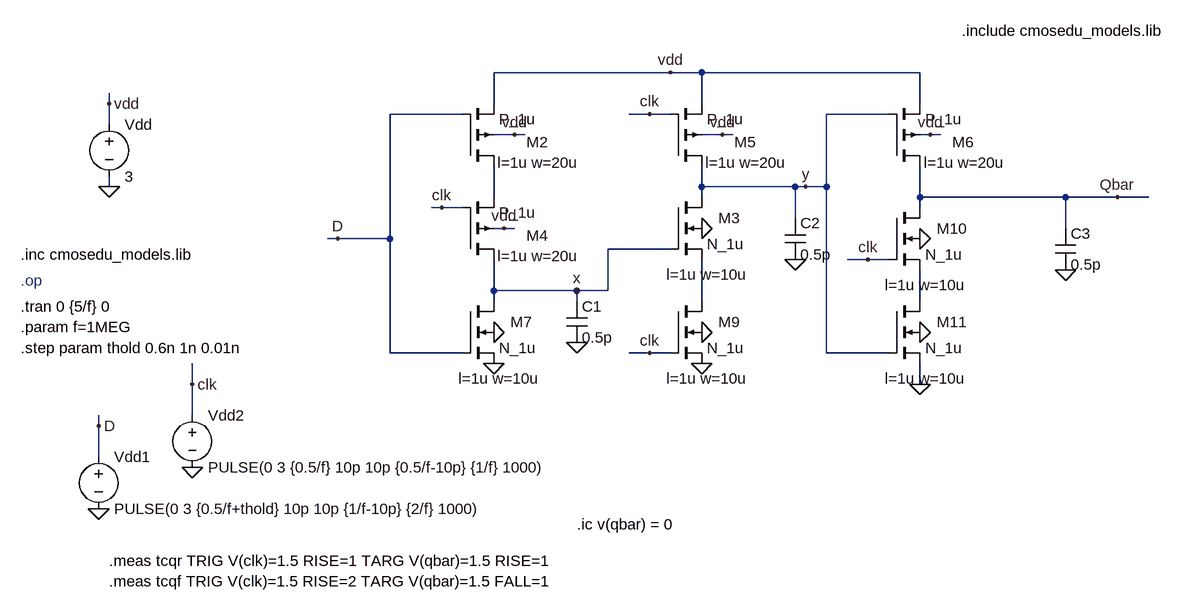
[diagram p0: schematic D_flipflop_hold_time.asc]
D_flipflop_hold_time.asc, the LTspice schematic file:
Version 4.1
SHEET 1 3268 1552
WIRE 1408 352 1136 352
WIRE 1456 352 1408 352
WIRE 1792 352 1456 352
WIRE 544 400 544 384
WIRE 1136 400 1136 352
WIRE 1456 400 1456 352
WIRE 1792 400 1792 352
WIRE 1088 416 976 416
WIRE 1376 416 1344 416
WIRE 1408 416 1376 416
WIRE 1744 416 1648 416
WIRE 544 432 544 400
WIRE 1168 448 1136 448
WIRE 1184 448 1168 448
WIRE 1488 448 1456 448
WIRE 1504 448 1488 448
WIRE 1808 448 1792 448
WIRE 1824 448 1808 448
WIRE 544 528 544 512
WIRE 1456 528 1456 496
WIRE 1600 528 1456 528
WIRE 1616 528 1600 528
WIRE 1648 528 1648 416
WIRE 1648 528 1616 528
WIRE 1136 544 1136 496
WIRE 1456 544 1456 528
WIRE 1792 544 1792 496
WIRE 2016 544 1792 544
WIRE 2096 544 2016 544
WIRE 2144 544 2096 544
WIRE 1056 560 1040 560
WIRE 1088 560 1056 560
WIRE 1792 560 1792 544
WIRE 1600 576 1600 528
WIRE 1152 592 1136 592
WIRE 1168 592 1152 592
WIRE 2016 592 2016 544
WIRE 896 608 880 608
WIRE 976 608 976 416
WIRE 976 608 896 608
WIRE 1408 624 1312 624
WIRE 1712 640 1680 640
WIRE 1744 640 1712 640
WIRE 1136 688 1136 640
WIRE 1264 688 1136 688
WIRE 1312 688 1312 624
WIRE 1312 688 1264 688
WIRE 1136 704 1136 688
WIRE 1264 704 1264 688
WIRE 1456 704 1456 640
WIRE 1792 704 1792 656
WIRE 976 784 976 608
WIRE 1088 784 976 784
WIRE 1376 784 1344 784
WIRE 1408 784 1376 784
WIRE 1648 784 1648 528
WIRE 1744 784 1648 784
WIRE 672 832 672 800
WIRE 1792 832 1792 800
WIRE 672 880 672 832
WIRE 528 896 528 880
WIRE 528 944 528 896
FLAG 544 528 0
FLAG 1136 752 0
FLAG 1456 752 0
FLAG 1792 608 0
FLAG 1792 752 0
FLAG 1168 448 vdd
FLAG 1408 352 vdd
FLAG 1488 448 vdd
FLAG 1808 448 vdd
FLAG 1152 592 vdd
FLAG 1376 416 clk
FLAG 1376 784 clk
FLAG 1712 640 clk
FLAG 1136 800 0
FLAG 1456 800 0
FLAG 1616 528 y
FLAG 672 960 0
FLAG 2096 544 Qbar
FLAG 1264 688 x
FLAG 544 400 vdd
FLAG 1456 592 0
FLAG 1792 832 0
FLAG 1264 768 0
FLAG 1600 640 0
FLAG 2016 656 0
FLAG 1056 560 clk
FLAG 896 608 D
FLAG 672 832 clk
FLAG 528 1024 0
FLAG 528 896 D
SYMBOL voltage 544 416 R0
WINDOW 123 0 0 Left 2
WINDOW 39 0 0 Left 2
SYMATTR InstName Vdd
SYMATTR Value 3
SYMBOL pmos4 1088 496 M180
WINDOW 123 54 5 Left 2
WINDOW 0 98 37 Left 2
SYMATTR Value2 l=1u w=20u
SYMATTR InstName M2
SYMATTR Value P_1u
SYMBOL pmos4 1088 640 M180
WINDOW 123 54 5 Left 2
WINDOW 0 98 37 Left 2
SYMATTR Value2 l=1u w=20u
SYMATTR InstName M4
SYMATTR Value P_1u
SYMBOL pmos4 1408 496 M180
WINDOW 123 54 5 Left 2
WINDOW 0 98 37 Left 2
SYMATTR Value2 l=1u w=20u
SYMATTR InstName M5
SYMATTR Value P_1u
SYMBOL pmos4 1744 496 M180
WINDOW 123 54 5 Left 2
WINDOW 0 98 37 Left 2
SYMATTR Value2 l=1u w=20u
SYMATTR InstName M6
SYMATTR Value P_1u
SYMBOL nmos4 1088 704 R0
WINDOW 123 -6 119 Left 2
WINDOW 0 74 32 Left 2
SYMATTR Value2 l=1u w=10u
SYMATTR InstName M7
SYMATTR Value N_1u
SYMBOL nmos4 1408 704 R0
WINDOW 123 -6 119 Left 2
WINDOW 0 74 32 Left 2
SYMATTR Value2 l=1u w=10u
SYMATTR InstName M9
SYMATTR Value N_1u
SYMBOL nmos4 1744 560 R0
WINDOW 123 -6 119 Left 2
WINDOW 0 74 32 Left 2
SYMATTR Value2 l=1u w=10u
SYMATTR InstName M10
SYMATTR Value N_1u
SYMBOL nmos4 1744 704 R0
WINDOW 123 -6 119 Left 2
WINDOW 0 74 32 Left 2
SYMATTR Value2 l=1u w=10u
SYMATTR InstName M11
SYMATTR Value N_1u
SYMBOL voltage 528 928 R0
WINDOW 123 0 0 Left 2
WINDOW 39 0 0 Left 2
SYMATTR InstName Vdd1
SYMATTR Value PULSE(0 3 {0.5/f+thold} 10p 10p {1/f-10p} {2/f} 1000)
SYMBOL nmos4 1408 544 R0
WINDOW 123 -6 119 Left 2
WINDOW 0 74 32 Left 2
SYMATTR Value2 l=1u w=10u
SYMATTR InstName M3
SYMATTR Value N_1u
SYMBOL cap 1248 704 R0
SYMATTR InstName C1
SYMATTR Value 0.5p
SYMBOL cap 1584 576 R0
SYMATTR InstName C2
SYMATTR Value 0.5p
SYMBOL cap 2000 592 R0
SYMATTR InstName C3
SYMATTR Value 0.5p
SYMBOL voltage 672 864 R0
WINDOW 123 0 0 Left 2
WINDOW 39 0 0 Left 2
SYMATTR InstName Vdd2
SYMATTR Value PULSE(0 3 {0.5/f} 10p 10p {0.5/f-10p} {1/f} 1000)
TEXT 408 632 Left 2 !.inc cmosedu_models.lib
TEXT 408 672 Left 2 ;.op
TEXT 408 712 Left 2 !.tran 0 {5/f} 0
TEXT 408 744 Left 2 !.param f=1MEG
TEXT 408 776 Left 2 !.step param thold 0.6n 1n 0.01n
TEXT 1264 1048 Left 2 !.ic v(qbar) = 0
TEXT 544 1104 Left 2 !.meas tcqr TRIG V(clk)=1.5 RISE=1 TARG V(qbar)=1.5 RISE=1\n.meas tcqf TRIG V(clk)=1.5 RISE=2 TARG V(qbar)=1.5 FALL=1
TEXT 1856 288 Left 2 !.include cmosedu_models.lib

The netlist it stands for:
* D_flipflop_hold_time.asc
Vdd vdd 0 3
M2 N001 D vdd vdd P_1u l=1u w=20u
M4 x clk N001 vdd P_1u l=1u w=20u
M5 y clk vdd vdd P_1u l=1u w=20u
M6 Qbar y vdd vdd P_1u l=1u w=20u
M7 x D 0 0 N_1u l=1u w=10u
M9 N002 clk 0 0 N_1u l=1u w=10u
M10 Qbar clk N003 0 N_1u l=1u w=10u
M11 N003 y 0 0 N_1u l=1u w=10u
Vdd1 D 0 PULSE(0 3 {0.5/f+thold} 10p 10p {1/f-10p} {2/f} 1000)
M3 y x N002 0 N_1u l=1u w=10u
C1 x 0 0.5p
C2 y 0 0.5p
C3 Qbar 0 0.5p
Vdd2 clk 0 PULSE(0 3 {0.5/f} 10p 10p {0.5/f-10p} {1/f} 1000)
.model NMOS NMOS
.model PMOS PMOS
.lib standard.mos
.inc cmosedu_models.lib
* .op
.tran 0 {5/f} 0
.param f=1MEG
.step param thold 0.6n 1n 0.01n
.ic v(qbar) = 0
.meas tcqr TRIG V(clk)=1.5 RISE=1 TARG V(qbar)=1.5 RISE=1
.meas tcqf TRIG V(clk)=1.5 RISE=2 TARG V(qbar)=1.5 FALL=1
.include cmosedu_models.lib
.backanno
.end